# Altium schematic sheet TemperatureMonitor.SchDoc
size 584 x 375 mm
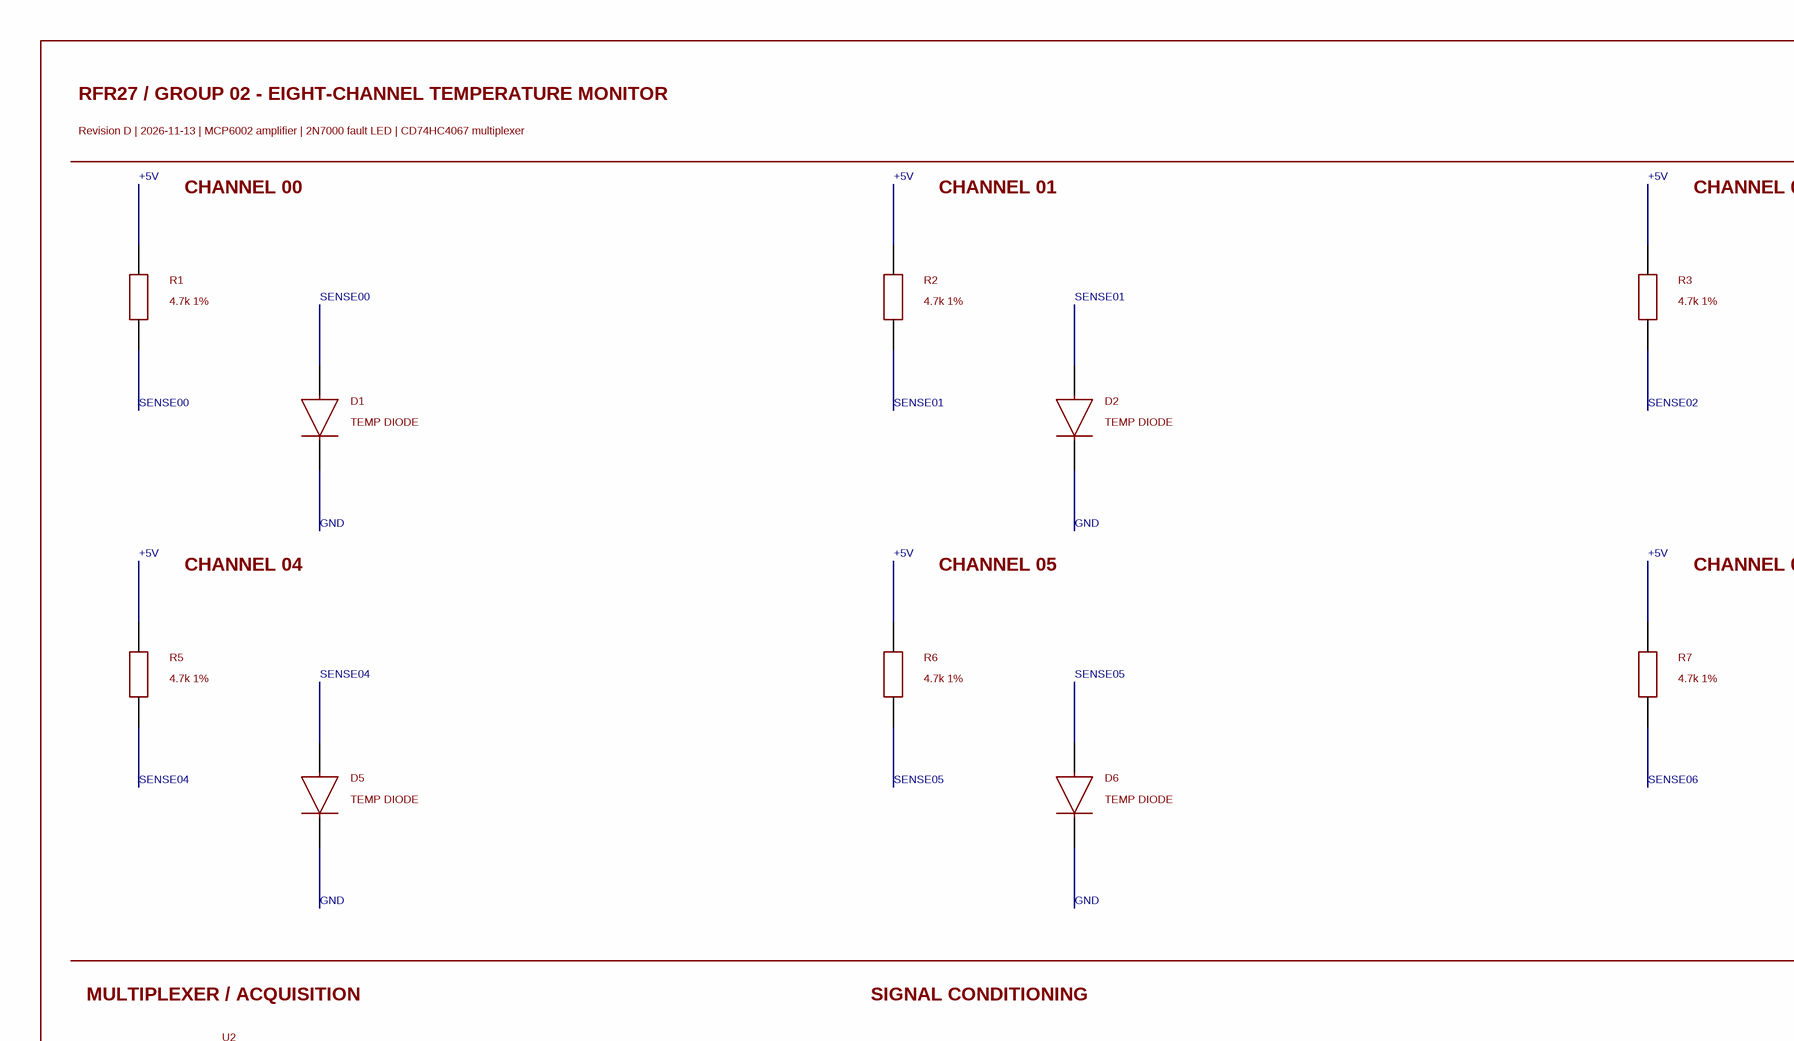
[diagram p0: TemperatureMonitor.SchDoc, top left]
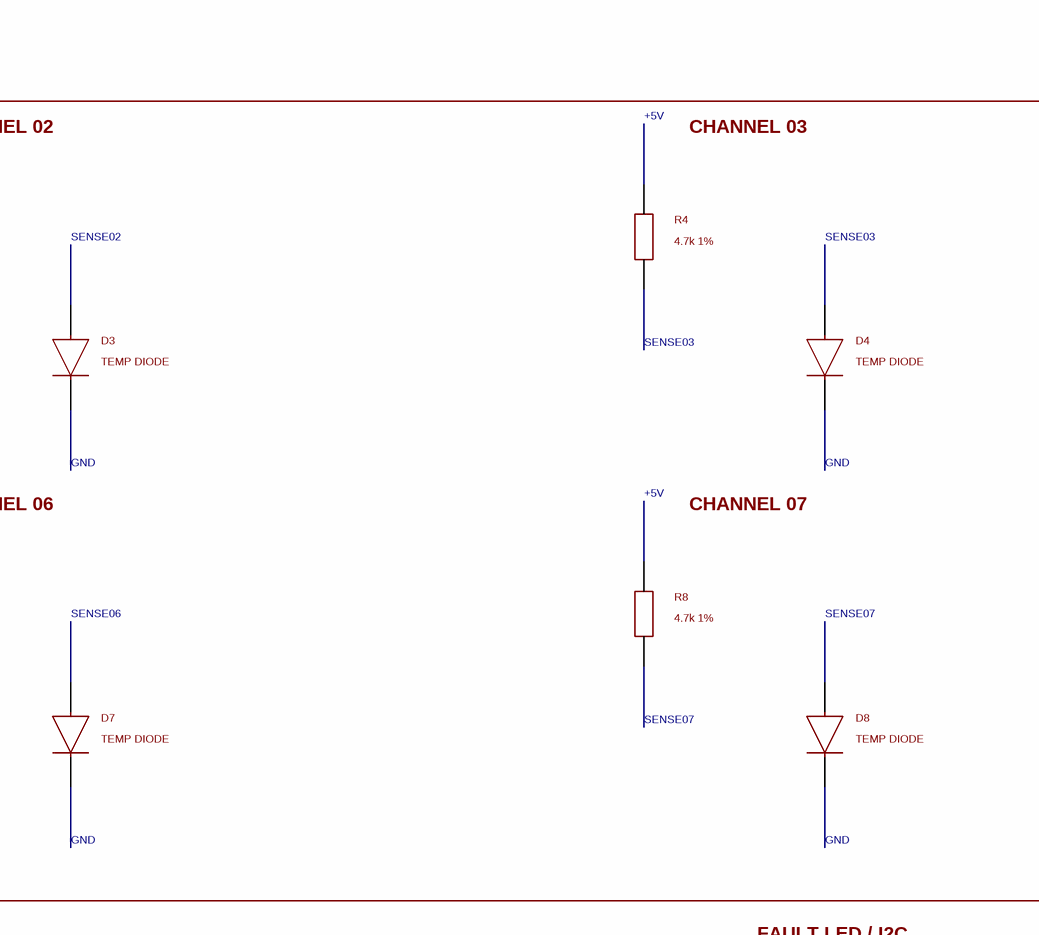
[diagram p1: TemperatureMonitor.SchDoc, top right]
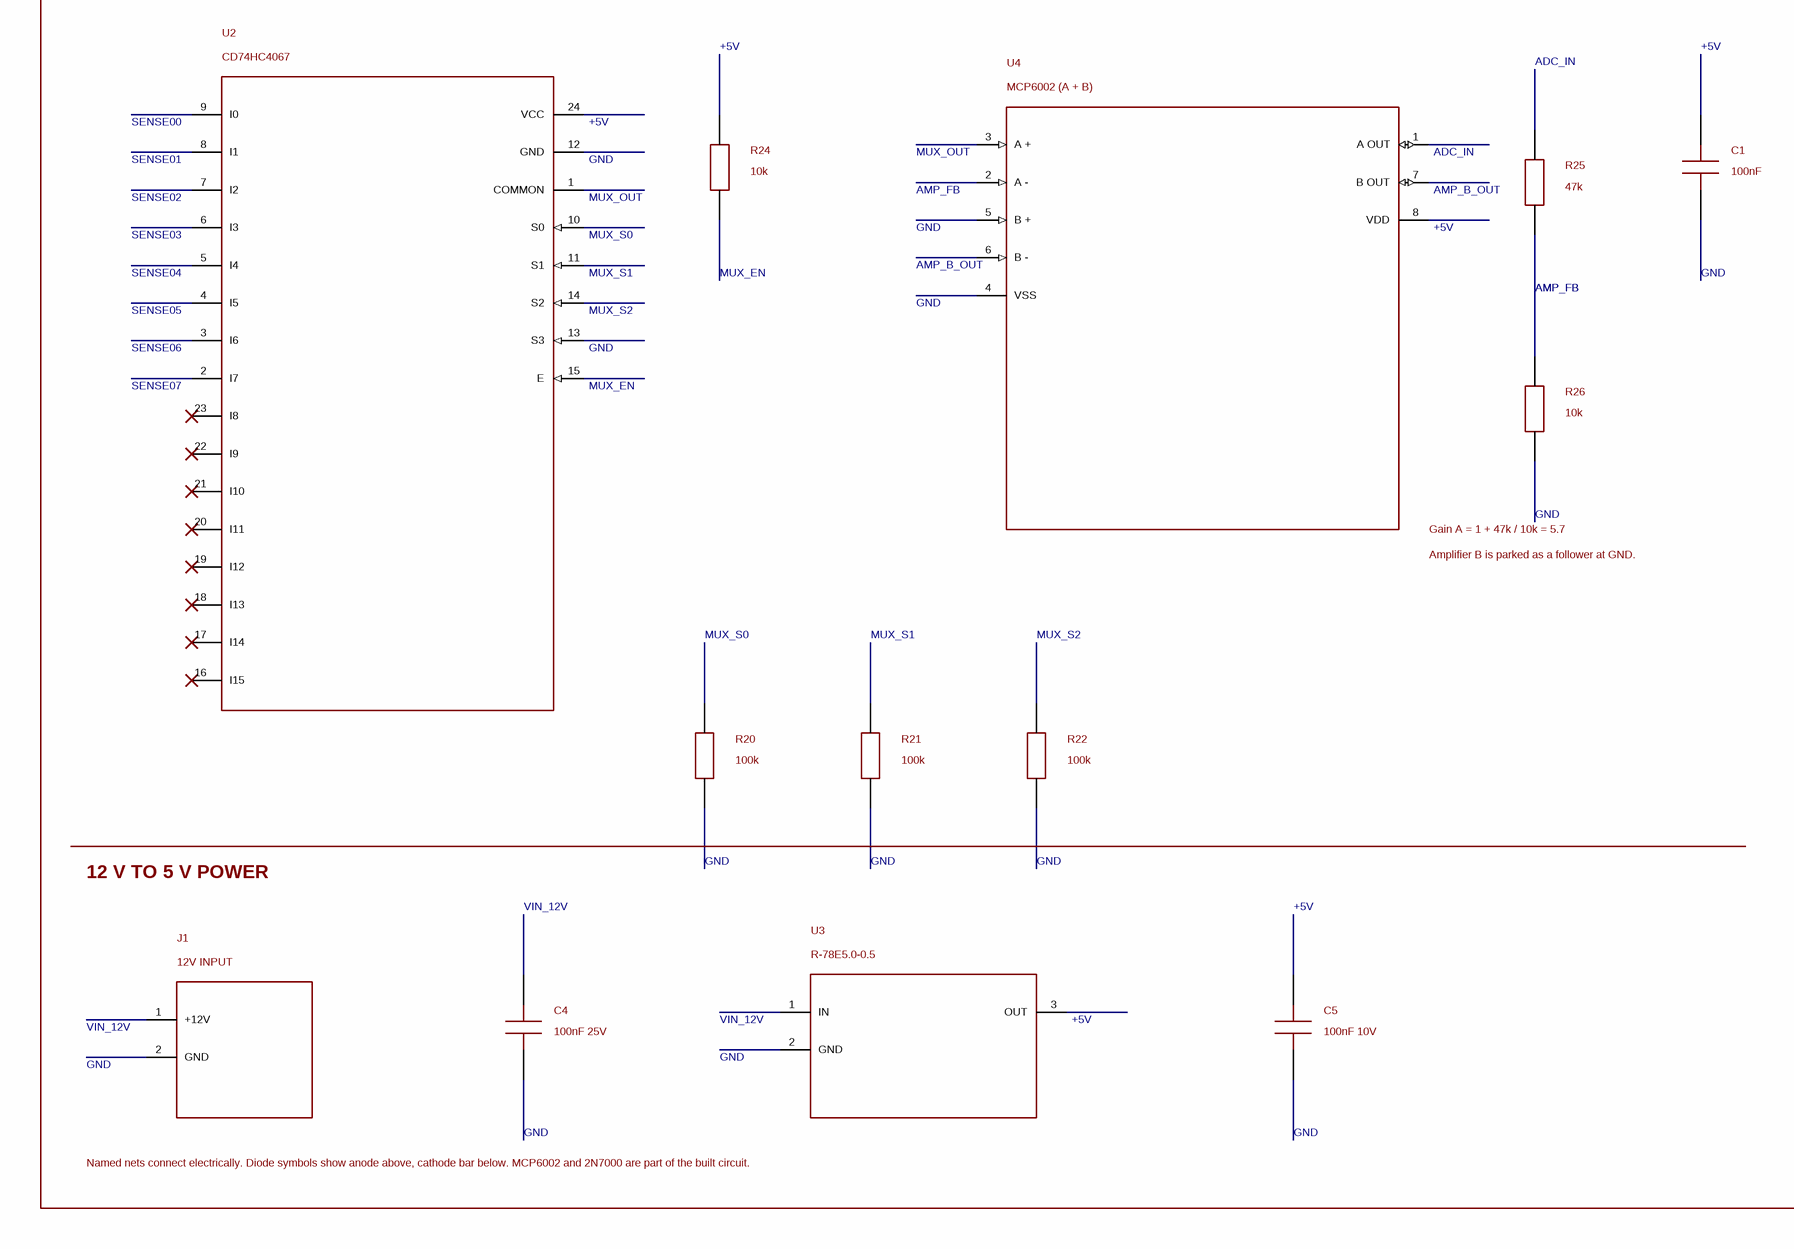
[diagram p2: TemperatureMonitor.SchDoc, bottom left]
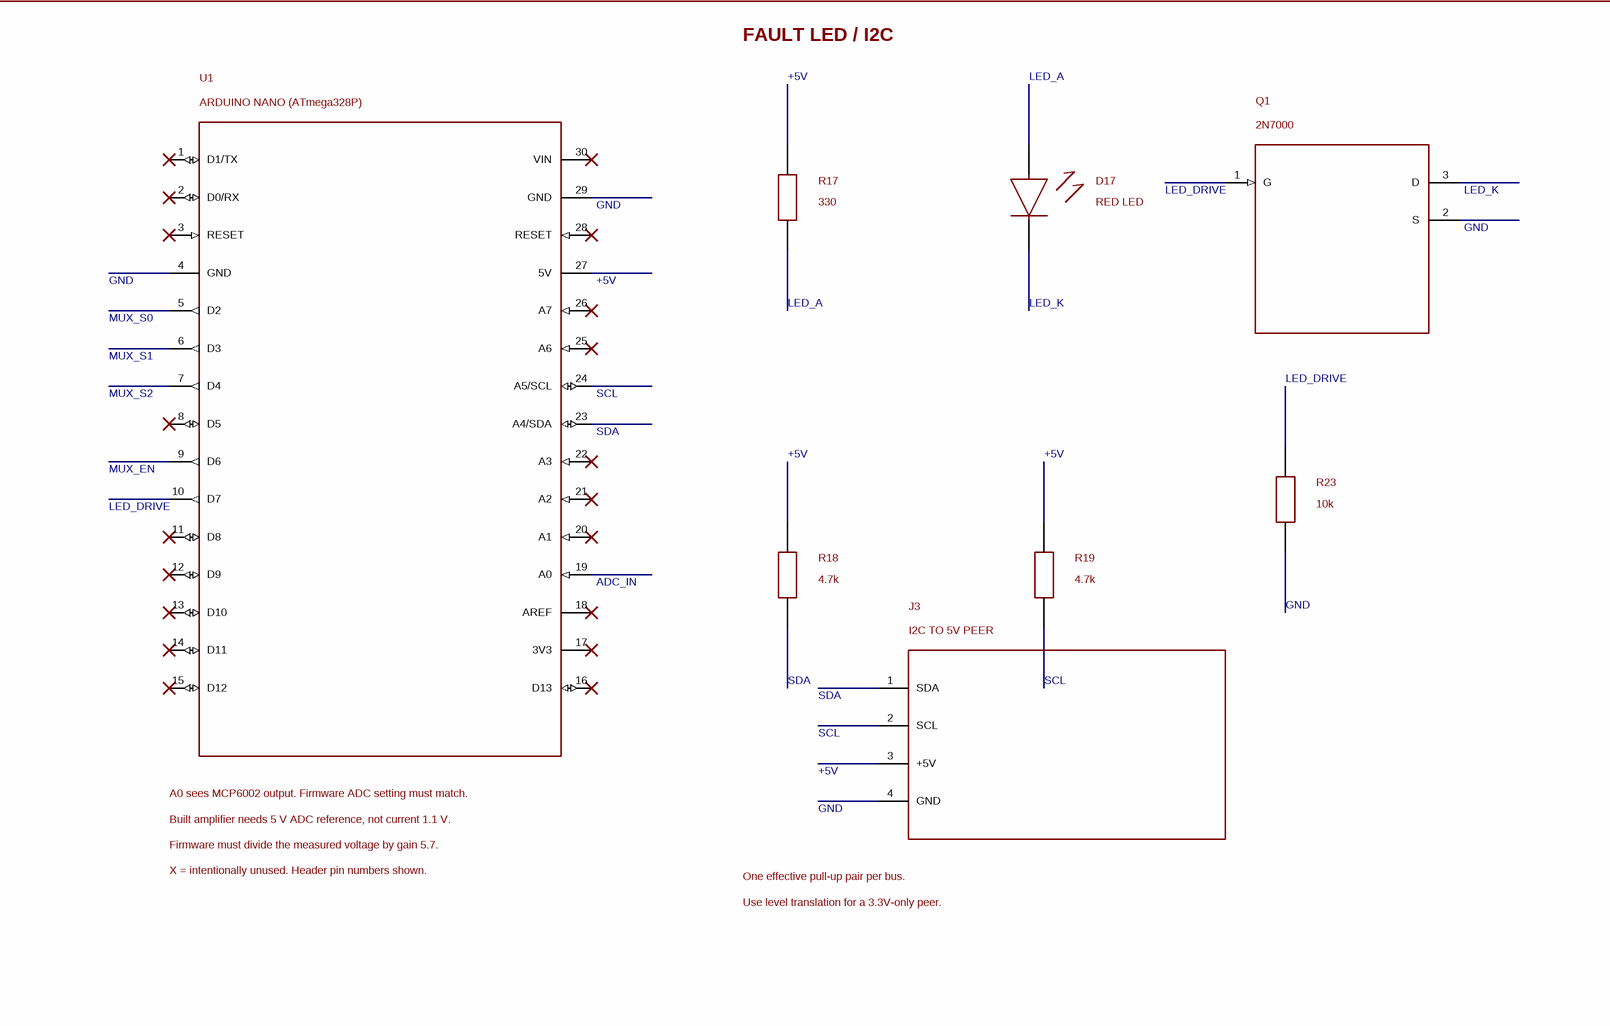
[diagram p3: TemperatureMonitor.SchDoc, bottom right]

## Parts
C1  100nF
C4  100nF 25V
C5  100nF 10V
D1  TEMP DIODE
D2  TEMP DIODE
D3  TEMP DIODE
D4  TEMP DIODE
D5  TEMP DIODE
D6  TEMP DIODE
D7  TEMP DIODE
D8  TEMP DIODE
D17  RED LED
J1  12V INPUT
J3  I2C TO 5V PEER
Q1  2N7000
R1  4.7k 1%
R2  4.7k 1%
R3  4.7k 1%
R4  4.7k 1%
R5  4.7k 1%
R6  4.7k 1%
R7  4.7k 1%
R8  4.7k 1%
R17  330
R18  4.7k
R19  4.7k
R20  100k
R21  100k
R22  100k
R23  10k
R24  10k
R25  47k
R26  10k
U1  ARDUINO NANO (ATmega328P)
U2  CD74HC4067
U3  R-78E5.0-0.5
U4  MCP6002 (A + B)

## Nets
+5V: C1.1 C5.1 J3.3(+5V) R1.1 R2.1 R3.1 R4.1 R5.1 R6.1 R7.1 R8.1 R17.1 R18.1 R19.1 R24.1 U1.27(5V) U2.24(VCC) U3.3(OUT) U4.8(VDD)
ADC_IN: R25.1 U1.19(A0) U4.1(A_OUT)
AMP_B_OUT: U4.6(B_-) U4.7(B_OUT)
AMP_FB: R25.2 R26.1 U4.2(A_-)
GND: C1.2 C4.2 C5.2 D1.K D2.K D3.K D4.K D5.K D6.K D7.K D8.K J1.2(GND) J3.4(GND) Q1.2(S) R20.2 R21.2 R22.2 R23.2 R26.2 U1.4(GND) U1.29(GND) U2.12(GND) U2.13(S3) U3.2(GND) U4.4(VSS) U4.5(B_+)
LED_A: D17.A R17.2
LED_DRIVE: Q1.1(G) R23.1 U1.10(D7)
LED_K: D17.K Q1.3(D)
MUX_EN: R24.2 U1.9(D6) U2.15(E)
MUX_OUT: U2.1(COMMON) U4.3(A_+)
MUX_S0: R20.1 U1.5(D2) U2.10(S0)
MUX_S1: R21.1 U1.6(D3) U2.11(S1)
MUX_S2: R22.1 U1.7(D4) U2.14(S2)
SCL: J3.2(SCL) R19.2 U1.24(A5/SCL)
SDA: J3.1(SDA) R18.2 U1.23(A4/SDA)
SENSE00: D1.A R1.2 U2.9(I0)
SENSE01: D2.A R2.2 U2.8(I1)
SENSE02: D3.A R3.2 U2.7(I2)
SENSE03: D4.A R4.2 U2.6(I3)
SENSE04: D5.A R5.2 U2.5(I4)
SENSE05: D6.A R6.2 U2.4(I5)
SENSE06: D7.A R7.2 U2.3(I6)
SENSE07: D8.A R8.2 U2.2(I7)
VIN_12V: C4.1 J1.1(+12V) U3.1(IN)

Not connected (* = marked no-connect by the designer): U1 1(D1/TX)* 2(D0/RX)* 3(RESET)* 8(D5)* 11(D8)* 12(D9)* 13(D10)* 14(D11)* 15(D12)* 16(D13)* 17(3V3)* 18(AREF)* 20(A1)* 21(A2)* 22(A3)* 25(A6)* 26(A7)* 28(RESET)* 30(VIN)*; U2 16(I15)* 17(I14)* 18(I13)* 19(I12)* 20(I11)* 21(I10)* 22(I9)* 23(I8)*

## Notes on the sheet
- RFR27 / GROUP 02 - EIGHT-CHANNEL TEMPERATURE MONITOR
- Revision D | 2026-11-13 | MCP6002 amplifier | 2N7000 fault LED | CD74HC4067 multiplexer
- CHANNEL 00
- CHANNEL 01
- CHANNEL 02
- CHANNEL 03
- CHANNEL 04
- CHANNEL 05
- CHANNEL 06
- CHANNEL 07
- MULTIPLEXER / ACQUISITION
- SIGNAL CONDITIONING
- FAULT LED / I2C
- Gain A = 1 + 47k / 10k = 5.7
- Amplifier B is parked as a follower at GND.
- A0 sees MCP6002 output. Firmware ADC setting must match.
- Built amplifier needs 5 V ADC reference, not current 1.1 V.
- Firmware must divide the measured voltage by gain 5.7.
- 12 V TO 5 V POWER
- X = intentionally unused. Header pin numbers shown.
- One effective pull-up pair per bus.
- Use level translation for a 3.3V-only peer.
- Named nets connect electrically. Diode symbols show anode above, cathode bar below. MCP6002 and 2N7000 are part of the built circuit.